# EAGLE design source_eagle (EAGLE 7.1.0)
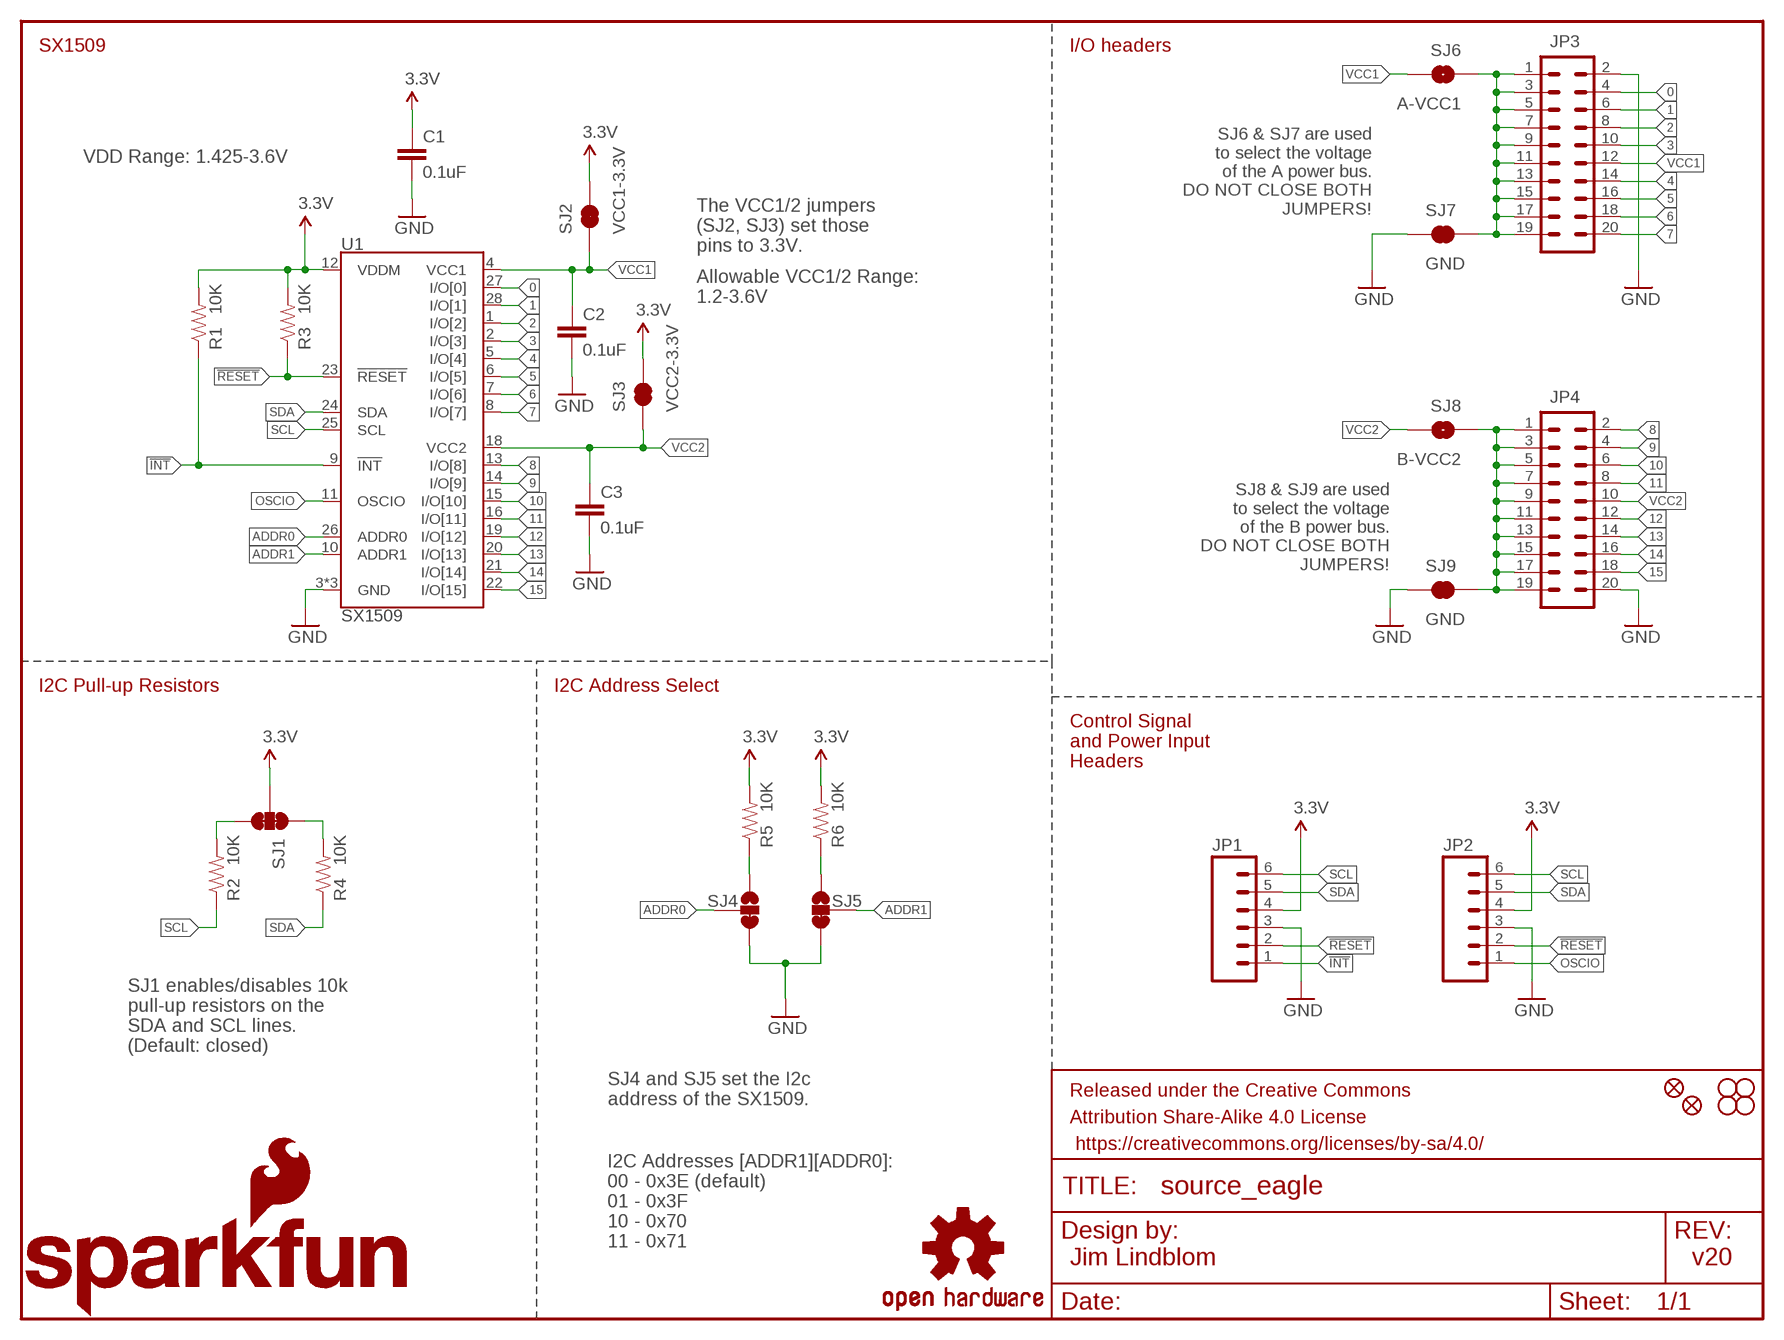
[diagram p0: schematic, sheet 1]

## Parts
C1  0.1uF  0.1UF-25V(+80/-20%)(0603)  [0603-CAP]
C2  0.1uF  0.1UF-25V(+80/-20%)(0603)  [0603-CAP]
C3  0.1uF  0.1UF-25V(+80/-20%)(0603)  [0603-CAP]
FRAME1  FRAME-LETTER  [CREATIVE_COMMONS]
JP1  M06SILK_FEMALE_PTH  [1X06]
JP2  M06SILK_FEMALE_PTH  [1X06]
JP3  M10X2ROUND_NOSILK  [2X10_ROUND_NOSILK]
JP4  M10X2ROUND_NOSILK  [2X10_ROUND_NOSILK]
JP9  FIDUCIAL1X2  [FIDUCIAL-1X2]
JP10  FIDUCIAL1X2  [FIDUCIAL-1X2]
LOGO1  SFE_LOGO_NAME_FLAME.1_INCH  [SFE_LOGO_NAME_FLAME_.1]
LOGO2  SFE_LOGO_FLAME.1_INCH  [SFE_LOGO_FLAME_.1]
LOGO3  OSHW-LOGOS  [OSHW-LOGO-S]
R1  10K  10KOHM-1/10W-1%(0603)0603  [0603-RES]
R2  10K  10KOHM-1/10W-1%(0603)0603  [0603-RES]
R3  10K  10KOHM-1/10W-1%(0603)0603  [0603-RES]
R4  10K  10KOHM-1/10W-1%(0603)0603  [0603-RES]
R5  10K  10KOHM-1/10W-1%(0603)0603  [0603-RES]
R6  10K  10KOHM-1/10W-1%(0603)0603  [0603-RES]
SJ1  JUMPER-PAD-3-NC_BY_TRACE  [PAD-JUMPER-3-3OF3_NC_BY_TRACE_YES_SILK_FULL_BOX]
SJ2  VCC1-3.3V  JUMPER-PAD-2-NC_BY_TRACE  [PAD-JUMPER-2-NC_BY_TRACE_YES_SILK]
SJ3  VCC2-3.3V  JUMPER-PAD-2-NC_BY_TRACE  [PAD-JUMPER-2-NC_BY_TRACE_YES_SILK]
SJ4  JUMPER-PAD-3-2OF3_NC_BY_TRACE_SMALL  [PAD-JUMPER-3-2OF3_NC_BY_TRACE_YES_SILK_FULL_BOX]
SJ5  JUMPER-PAD-3-2OF3_NC_BY_TRACE_SMALL  [PAD-JUMPER-3-2OF3_NC_BY_TRACE_YES_SILK_FULL_BOX]
SJ6  A-VCC1  JUMPER-PAD-2-NO  [PAD-JUMPER-2-NO_NO_SILK]
SJ7  GND  JUMPER-PAD-2-NC_BY_TRACENO_SILK  [PAD-JUMPER-2-NC_BY_TRACE_NO_SILK]
SJ8  B-VCC2  JUMPER-PAD-2-NO  [PAD-JUMPER-2-NO_NO_SILK]
SJ9  GND  JUMPER-PAD-2-NC_BY_TRACENO_SILK  [PAD-JUMPER-2-NC_BY_TRACE_NO_SILK]
STANDOFF1  STAND-OFF  [STAND-OFF]
STANDOFF2  STAND-OFF  [STAND-OFF]
STANDOFF3  STAND-OFF  [STAND-OFF]
STANDOFF4  STAND-OFF  [STAND-OFF]
U1  SX1509  [QFN-28]

## Nets
0: JP3.4 U1.27(I/O[0])
1: JP3.6 U1.28(I/O[1])
2: JP3.8 U1.1(I/O[2])
3: JP3.10 U1.2(I/O[3])
3.3V: C1.1 JP1.4 JP2.4 R1.2 R3.2 R5.2 R6.2 SJ1.2 SJ2.2 SJ3.2 U1.12(VDDM)
4: JP3.14 U1.5(I/O[4])
5: JP3.16 U1.6(I/O[5])
6: JP3.18 U1.7(I/O[6])
7: JP3.20 U1.8(I/O[7])
8: JP4.2 U1.13(I/O[8])
9: JP4.4 U1.14(I/O[9])
10: JP4.6 U1.15(I/O[10])
11: JP4.8 U1.16(I/O[11])
12: JP4.12 U1.19(I/O[12])
13: JP4.14 U1.20(I/O[13])
14: JP4.16 U1.21(I/O[14])
15: JP4.18 U1.22(I/O[15])
!INT: JP1.1 R1.1 U1.9(!INT)
!RESET: JP1.2 JP2.2 R3.1 U1.23(!RESET)
ADDR0: SJ4.2 U1.26(ADDR0)
ADDR1: SJ5.2 U1.10(ADDR1)
GND: C1.2 C2.2 C3.2 JP1.3 JP2.3 JP3.2 JP4.20 SJ4.3 SJ5.3 SJ7.1 SJ9.1 U1.3(GND) U1.17(GND) U1.29(GND)
N$1: R2.2 SJ1.3
N$2: R4.2 SJ1.1
N$3: JP4.1 JP4.3 JP4.5 JP4.7 JP4.9 JP4.11 JP4.13 JP4.15 JP4.17 JP4.19 SJ8.1 SJ9.2
N$8: R5.1 SJ4.1
N$9: R6.1 SJ5.1
OSCIO: JP2.1 U1.11(OSCIO)
PWRBUSA: JP3.1 JP3.3 JP3.5 JP3.7 JP3.9 JP3.11 JP3.13 JP3.15 JP3.17 JP3.19 SJ6.1 SJ7.2
SCL: JP1.6 JP2.6 R2.1 U1.25(SCL)
SDA: JP1.5 JP2.5 R4.1 U1.24(SDA)
VCC1: C2.1 JP3.12 SJ2.1 SJ6.2 U1.4(VCC1)
VCC2: C3.1 JP4.10 SJ3.1 SJ8.2 U1.18(VCC2)

## Notes on the sheet
- SX1509 | I/O headers
- SJ6 & SJ7 are used
  to select the voltage
  of the A power bus.
  DO NOT CLOSE BOTH
  JUMPERS!
- VDD Range: 1.425-3.6V
- The VCC1/2 jumpers 
  (SJ2, SJ3) set those 
  pins to 3.3V.
- Allowable VCC1/2 Range: 
  1.2-3.6V
- SJ8 & SJ9 are used
  to select the voltage
  of the B power bus.
  DO NOT CLOSE BOTH
  JUMPERS!
- I2C Pull-up Resistors | I2C Address Select
- Control Signal
  and Power Input
  Headers
- SJ1 enables/disables 10k
  pull-up resistors on the
  SDA and SCL lines.
  (Default: closed)
- SJ4 and SJ5 set the I2c
  address of the SX1509.
- I2C Addresses [ADDR1][ADDR0]:
  00 - 0x3E (default)
  01 - 0x3F
  10 - 0x70
  11 - 0x71
- Jim Lindblom | v20

## Library data of the parts
C1-C3 = SparkFun-Capacitors:0.1UF-25V(+80/-20%)(0603): CAP-00810 Ceramic Standard decoupling cap; PROD_ID: CAP-00810
FRAME1 = SparkFun-Aesthetics:FRAME-LETTER: Schematic Frame Standard 8.5x11 US Letter frame; DESIGNER: NAME; VERSION: v01
JP1 JP2 = SparkFun-Connectors:M06: Header 6 Standard 6-pin 0.1" header. Use with straight break away headers (SKU : PRT-00116), right angle break away headers (PRT-00553), swiss pins (PRT-00743), machine pins (PRT-00117), and female headers (PRT-00115). Molex polarized connector foot print use with SKU : PRT-08094 with associated crimp pins and housings. NOTES ON THE VARIANTS LOCK and LOCK_LONGPADS... This footprint was designed to help hold the alignment of a through-hole component (i.e. 6-pin header) while soldering it into place. You may notice that each hole has been shifted either up or down by 0.005 of an inch from it's more standard position (which is a perfectly straight line). This slight alteration caused the pins (the squares in the middle) to touch the edges of the holes. Because they are alternating, it causes a "brace" to hold the component in place. 0.005 has proven to be the perfect amount of "off-center" position when using our standard breakaway headers. Although looks a little odd when you look at the bare footprint, once you have a header in there, the alteration is very hard to notice. Also,if you push a header all the way into place, it is covered up entirely on the bottom side. This idea of altering the position of holes to aid alignment will be further integrated into the Sparkfun Library for other footprints. It can help hold any component with 3 or more connection pins.; PROD_ID: CONN-08437
JP3 JP4 = SparkFun-Connectors:M10X2: This was SPECIALLY designed to be used with our Graphic LCD Backpack. Be sure you want to use this! It is not only staggered on each line of header holes, but IT IS ALSO offset of the center point of the top and bottom lines by 5 mil. This causes the headers to lock into place on the "standard" footprint on the LCD screen. The extra squares on the tdocu layer are there simply to reference other pins (if you were to actually populate a longer header than ten long - this is what we do with the backpacks).
JP9 JP10 = SparkFun:FIDUCIAL: Fiducial Alignment Points Various fiducial points for machine vision alignment.
LOGO1 = SparkFun-Aesthetics:SFE_LOGO_NAME_FLAME: SFE Logo, name and flame This is the SparkFun full logo. The logo on the schematic will always be the same size; the package variant is the height of the flame part of the logo. Default layer for the logo on the board is tSilk.
LOGO2 = SparkFun-Aesthetics:SFE_LOGO_FLAME: SFE Logo, flame only This is the SparkFun flame logo. The logo on the schematic will always be the same size; the package variant is the height of the flame. Default layer for the logo on the board is tSilk.
LOGO3 = SparkFun-Aesthetics:OSHW-LOGO: Open Source Hardware Logo This logo indicates the piece of hardware it is found on incorporates a OSHW license and/or adheres to the definition of open source hardware found here: http://freedomdefined.org/OSHW
R1-R6 = SparkFun-Resistors:10KOHM-1/10W-1%(0603): RES-00824; PROD_ID: RES-00824
SJ1 = SparkFun-Passives:JUMPER-PAD-3-NC_BY_TRACE
SJ2 SJ3 SJ7 SJ9 = SparkFun-Passives:JUMPER-PAD-2-NC_BY_TRACE
SJ4 SJ5 = SparkFun-Passives:JUMPER-PAD-3-2OF3_NC_BY_TRACE
SJ6 SJ8 = SparkFun-Passives:JUMPER-PAD-2-NO
STANDOFF1-STANDOFF4 = SparkFun-Electromechanical:STAND-OFF: #4 Stand Off This is the mechanical footprint for a #4 phillips button head screw. Use the keepout ring to avoid running the screw head into surrounding components. SKU : PRT-00447
U1 = SparkFun-DigitalIC:SX1509: Semtech SX1509 The SX1509 is a complete ultra low voltage 1.2V to 3.6V General Purpose parallel Input/Output (GPIO) expanders ideal for low power handheld battery powered equipment. This version comes in a 16-channel configuration and allows easy serial expansion of I/O through a standard 400kHz I2C interface. GPIO devices can provide additional control and monitoring when the microcontroller or chipset has insufficient I/O ports, or in systems where serial communication and control from a remote location is advantageous.; PROD_ID: IC-11311

## Board
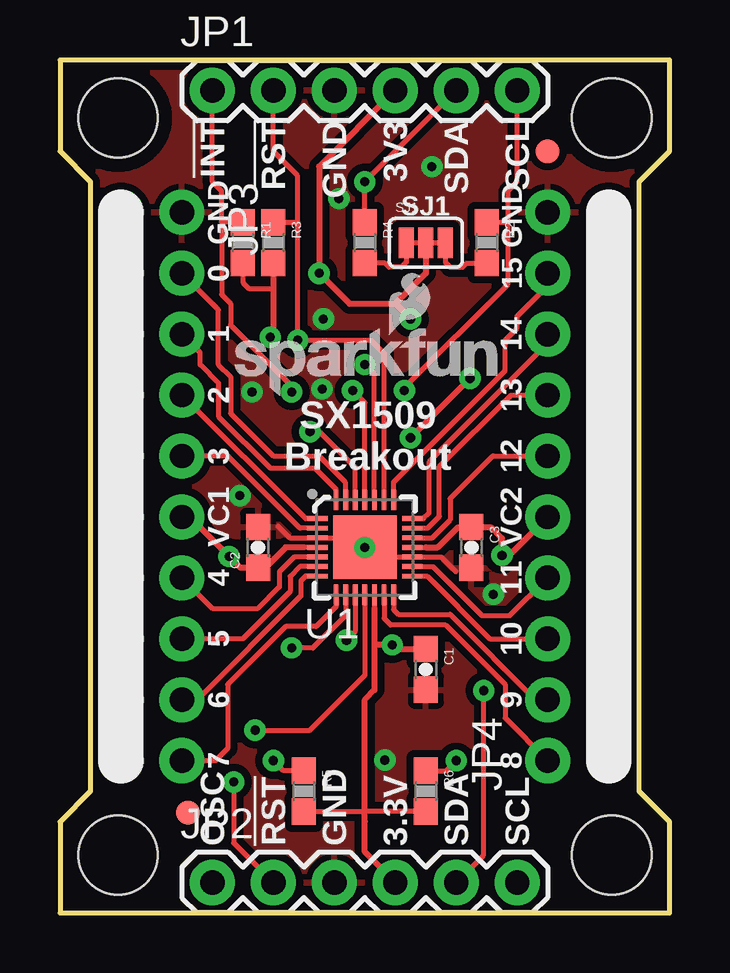
[diagram p1: board, top side]
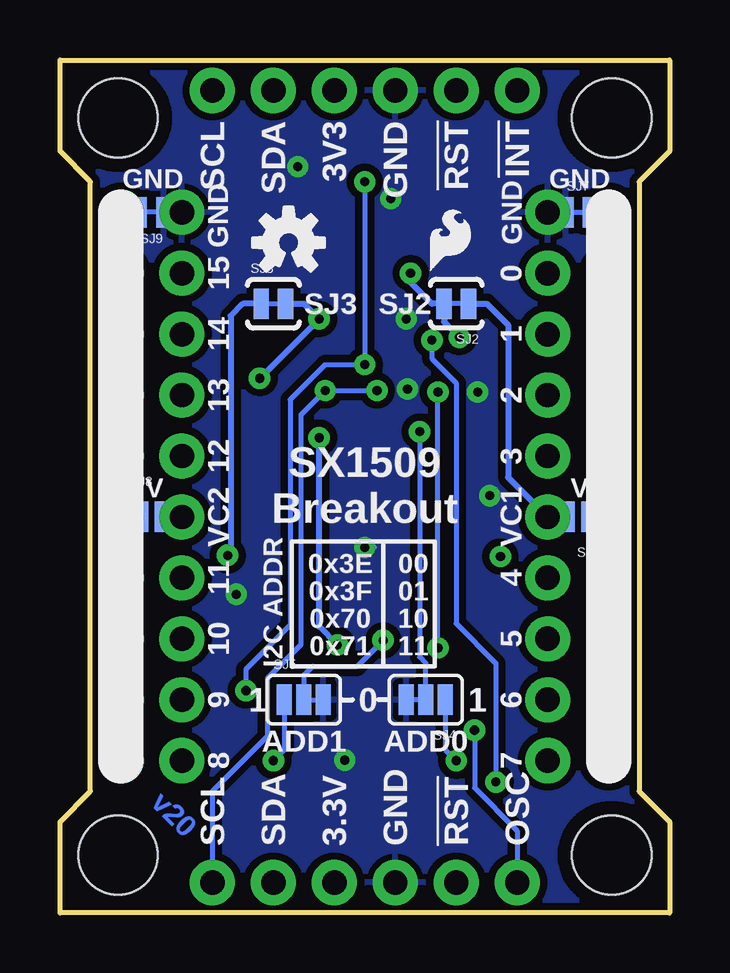
[diagram p2: board, bottom side, seen from below]

Size 25.4 x 35.56 mm. Coordinates in mm from the lower left corner, seen from the top.
Outline: 0,35.56 0,31.75 1.27,30.48 1.27,5.08 0,3.81 0,0 25.4,0 25.4,3.81 24.13,5.08 24.13,30.48 25.4,31.75 25.4,35.56 0,35.56
Copper layers (1*16): Top 0.035mm / dielectric 1.5mm / Bottom 0.035mm
Design rules "SparkFun-2-layer *": minimum track width 7mil, minimum drill 15mil, track to track 6mil, track to pad 6mil, pad to pad 6mil, via to via 6mil, smd to smd 6mil, copper to edge 8mil, drill to drill 8mil, minimum pad ring 12mil, minimum via ring 10mil, stop-mask expansion 4mil, vias tented up to drill 20mil, thermal gap 10mil

### Footprints (pad centres in the part's own frame; a part is rotated, then mirrored left to right if it is on the bottom)
0603-CAP = smd 1.1 x 1: 1 -0.85,0; 2 0.85,0
1X06 = drill 1.016 pad 1.88: 1 0,0; 2 2.54,0; 3 5.08,0; 4 7.62,0; 5 10.16,0; 6 12.7,0
2X10_ROUND_NOSILK = drill 1.016 pad 1.88: 1 -11.43,-1.27; 2 -11.43,1.27; 3 -8.89,-1.27; 4 -8.89,1.27; 5 -6.35,-1.27; 6 -6.35,1.27; 7 -3.81,-1.27; 8 -3.81,1.27; 9 -1.27,-1.27; 10 -1.27,1.27; 11 1.27,-1.27; 12 1.27,1.27; 13 3.81,-1.27; 14 3.81,1.27; 15 6.35,-1.27; 16 6.35,1.27; 17 8.89,-1.27; 18 8.89,1.27; 19 11.43,-1.27; 20 11.43,1.27
FIDUCIAL-1X2 = smd 1 x 1: 1 0,0
0603-RES = smd 1.1 x 1: 1 -0.85,0; 2 0.85,0
PAD-JUMPER-3-3OF3_NC_BY_TRACE_YES_SILK_FULL_BOX = smd 0.635 x 1.27: 1 -0.813,0; 2 0,0; 3 0.813,0
PAD-JUMPER-2-NC_BY_TRACE_YES_SILK = smd 0.635 x 1.27: 1 -0.508,0; 2 0.508,0
PAD-JUMPER-3-2OF3_NC_BY_TRACE_YES_SILK_FULL_BOX = smd 0.635 x 1.27: 1 -0.813,0; 2 0,0; 3 0.813,0
PAD-JUMPER-2-NO_NO_SILK = smd 0.635 x 1.27: 1 -0.45,0; 2 0.45,0
PAD-JUMPER-2-NC_BY_TRACE_NO_SILK = smd 0.635 x 1.27: 1 -0.508,0; 2 0.508,0
STAND-OFF = hole 3.302: 0,0
QFN-28 = smd 0.85 x 0.2: 1 -1.975,1.2; 2 -1.975,0.8; 3 -1.975,0.4; 4 -1.975,0; 5 -1.975,-0.4; 6 -1.975,-0.8; 7 -1.975,-1.2; 15 1.975,-1.2; 16 1.975,-0.8; 17 1.975,-0.4; 18 1.975,0; 19 1.975,0.4; 20 1.975,0.8; 21 1.975,1.2 | smd 0.2 x 0.85: 8 -1.2,-1.975; 9 -0.8,-1.975; 10 -0.4,-1.975; 11 0,-1.975; 12 0.4,-1.975; 13 0.8,-1.975; 14 1.2,-1.975; 22 1.2,1.975; 23 0.8,1.975; 24 0.4,1.975; 25 0,1.975; 26 -0.4,1.975; 27 -0.8,1.975; 28 -1.2,1.975 | smd 2.65 x 2.65: 29 0,0

### Placement (x,y rotation side)
C1  15.24,10.16 270 top
C2  8.26,15.24 90 top
C3  17.14,15.24 270 top
FRAME1  not placed on the board
JP1  6.35,34.29 0 top
JP2  6.35,1.27 0 top
JP3  3.81,17.78 270 top
JP4  21.59,17.78 90 top
JP9  20.32,31.75 0 top
JP10  5.33,4.19 0 top
LOGO1  6.86,21.46 0 top
LOGO2  10.29,26.42 0 bottom
LOGO3  15.88,27.94 0 bottom
R1  7.62,27.94 270 top
R2  17.78,27.94 270 top
R3  8.89,27.94 270 top
R4  12.7,27.94 270 top
R5  10.16,5.08 270 top
R6  15.24,5.08 270 top
SJ1  15.24,27.94 0 top
SJ2  8.89,25.4 180 bottom
SJ3  16.51,25.4 0 bottom
SJ4  10.16,8.89 180 bottom
SJ5  15.24,8.89 0 bottom
SJ6  3.81,16.51 180 bottom
SJ7  3.81,29.21 0 bottom
SJ8  21.59,16.51 0 bottom
SJ9  21.59,29.21 180 bottom
STANDOFF1  2.41,2.41 0 top
STANDOFF2  2.41,33.15 0 top
STANDOFF3  22.99,2.41 0 top
STANDOFF4  22.99,33.15 0 top
U1  12.7,15.24 0 top

### Tracks (layer width: path | path; a pad name or v marks a point on that pad's centre or on a via)
0
  Top 0.203: U1.27 11.9,17.95 10.79,19.05 8.89,19.05 7.11,20.83 7.11,22.35 6.6,22.86 6.6,25.15 JP3.4
1
  Top 0.203: U1.28 11.5,17.65 10.6,18.54 8.76,18.54 6.6,20.7 6.6,22.1 5.84,22.86 5.84,23.37 JP3.6
2
  Top 0.203: U1.1 10.23,16.44 JP3.8
3
  Top 0.203: U1.2 9.99,16.04 6.99,19.05 JP3.10
3.3V  (via drill 0.38)
  Top 0.203: U1.12 13.1,12.7 | R5.2 12.7,4.23 | R6.2 12.7,4.23 | 12.7,4.23 12.7,3.81 | R1.2 7.62,26.29 7.87,26.04 8.89,26.04
  Top 0.254: JP1.4 10.79,31.11 v10.79,26.67 12.06,25.4 13.97,25.4 | v14.61,24.77 13.97,25.4 | JP2.4 12.7,2.54 12.7,3.81 12.7,8.89 13.1,9.29 13.1,11.18 | 13.1,11.18 v13.84,11.18 14.01,11.01 C1.1 | 13.1,12.7 13.1,11.18 | v17.08,22.29 v14.61,19.81 | SJ1.2 15.24,26.67 13.97,25.4 | R3.2 8.89,26.04 8.89,24.13 v8.76,24
  Bottom 0.254: v17.08,22.29 v14.61,24.77 15.24,25.4 SJ3.2 | v13.84,11.18 14.61,11.94 v14.61,19.81 | v8.76,24 9.4,24.64 SJ2.2 9.91,25.4 10.79,26.29 v10.79,26.67
4
  Top 0.203: U1.5 9.76,14.84 9.14,14.22 9.14,13.59 8.26,12.7 6.35,12.7 JP3.14
5
  Top 0.203: U1.6 9.99,14.44 9.59,14.03 9.59,13.4 7.62,11.43 JP3.16
6
  Top 0.203: U1.7 10.23,14.04 10.03,13.84 10.03,13.21 5.71,8.89 JP3.18
7
  Top 0.203: U1.8 11.5,12.77 10.67,11.94 9.4,11.94 6.99,9.53 6.99,6.86 6.48,6.35 JP3.20
8
  Top 0.203: U1.13 13.5,12.28 13.78,12 16.07,12 18.54,9.53 18.54,8.13 JP4.2
9
  Top 0.203: U1.14 13.9,12.64 14.1,12.45 16.26,12.45 19.81,8.89 JP4.4
10
  Top 0.203: U1.15 15.3,14.04 17.91,11.43 JP4.6
11
  Top 0.203: U1.16 15.53,14.44 17.58,12.39 18.75,12.39 JP4.8
12
  Top 0.203: U1.19 15.51,15.64 16.26,16.38 16.26,17.27 18.03,19.05 JP4.12
13
  Top 0.203: U1.20 15.32,16.04 15.81,16.54 15.81,18.61 18.8,21.59 JP4.14
14
  Top 0.203: U1.21 15.14,16.44 15.37,16.66 15.37,18.8 20.32,23.75 JP4.16
15
  Top 0.203: U1.22 13.9,17.96 18.54,22.61 18.54,23.88 19.05,24.38 19.05,24.89 20.32,26.16 JP4.18
!INT  (via drill 0.38)
  Top 0.203: U1.9 11.9,12.41 10.54,11.05 v9.65,11.05 | 6.73,28.79 6.73,30.1 6.35,30.48 JP1.1 | R1.1 6.73,28.79 | v9.65,21.72 9.65,21.97 7.11,24.51 7.11,25.4 6.73,25.78 6.73,28.79
  Bottom 0.203: v9.65,11.05 v9.65,21.72
!RESET  (via drill 0.38)
  Top 0.203: U1.23 13.5,23.33 12.95,23.88 v9.91,23.88 9.91,28.79 | JP1.2 8.89,31.75 9.91,30.73 9.91,28.79 | R3.1 9.91,28.79 | v7.24,5.46 7.24,2.92 JP2.2
  Bottom 0.203: v7.24,5.46 7.24,10.41 8.89,12.06 8.89,22.1 9.91,23.11 v9.91,23.88
ADDR0  (via drill 0.38)
  Top 0.203: U1.26 12.3,18.56 10.79,20.07 v10.41,20.07
  Bottom 0.203: v10.41,20.07 10.41,10.67 10.16,10.41 SJ4.2
ADDR1  (via drill 0.38)
  Top 0.203: U1.10 12.3,11.73 v11.94,11.37
  Bottom 0.203: SJ5.2 15.24,9.91 14.86,10.29 13.02,10.29 v11.94,11.37
GND  (via drill 0.38)
  Top 0.203: 12.7,15.64 U1.29 | 16.51,14.22 15.89,14.84 U1.17 13.1,14.84 U1.29 | 9.08,16.13 9.57,15.64 U1.3 12.3,15.64 U1.29
  Bottom 0.203: U1.29 12.3,15.24 | SJ7.1 JP3.2 | SJ9.1 JP4.20
  other vias: 12.7,15.24 10.92,21.84 10.97,24.77 11.62,29.78 15.49,31.11 13.54,6.38 18.06,13.28 7.49,17.4 8,21.72
  pour Top (isolate 0.305): 0,35.56 0,0 25.4,0 25.4,35.56
  pour Bottom (isolate 0.305): 0,35.56 0,0 25.4,0 25.4,35.56
N$1
  Top 0.203: SJ1.3 16.05,27.13 16.26,26.92 16.76,26.92 16.93,27.09 R2.2
N$2
  Top 0.203: SJ1.1 14.43,27.13 14.22,26.92 13.72,26.92 13.55,27.09 R4.2
N$3
  Top 0.254: JP4.19 JP4.17 JP4.15 JP4.13 JP4.11 JP4.9 JP4.7 JP4.5 JP4.3 JP4.1
  Bottom 0.203: SJ8.1 JP4.9 | SJ9.2 JP4.19
N$8  (via drill 0.38)
  Top 0.203: R5.1 9.31,5.93 v8.89,6.35
  Bottom 0.203: SJ4.1 9.35,6.81 v8.89,6.35
N$9  (via drill 0.38)
  Top 0.203: R6.1 16.09,5.93 v16.51,6.35
  Bottom 0.203: SJ5.1 16.05,6.81 v16.51,6.35
OSCIO  (via drill 0.38)
  Top 0.203: U1.11 12.7,9.91 10.41,7.62 v8.13,7.62
  Bottom 0.203: v8.13,7.62 8.13,5.21 6.35,3.43 JP2.1
PWRBUSA
  Top 0.254: JP3.19 JP3.17 JP3.15 JP3.13 JP3.11 JP3.9 JP3.7 JP3.5 JP3.3 JP3.1
  Bottom 0.203: SJ6.1 JP3.11 | SJ7.2 JP3.1
SCL  (via drill 0.38)
  Top 0.203: U1.25 12.7,21.27 v12.19,21.78 | 18.67,28.79 18.67,26.23 14.35,21.91 v14.35,21.78 | 18.67,28.79 18.67,30.1 19.05,30.48 JP1.6 | R2.1 18.67,28.79
  Bottom 0.203: v12.19,21.78 v14.35,21.78 15.37,20.77 15.37,11.18 16.76,9.78 16.76,7.37 19.05,5.08 JP2.6
SDA  (via drill 0.38)
  Top 0.203: U1.24 13.1,22.46 v12.7,22.86 | JP1.5 v12.7,30.48 R4.1 | JP2.5 17.65,2.41 v17.65,9.27
  Bottom 0.203: v17.65,9.27 17.65,10.16 15.81,12 15.81,21.4 14.35,22.86 v12.7,22.86 v12.7,30.48
VCC1  (via drill 0.38)
  Top 0.203: U1.4 10.16,15.24
  Top 0.254: 10.16,15.24 9.4,15.24 8.55,14.39 C2.1 7.52,14.39 v7.05,14.86 5.4,16.51 JP3.12
  Bottom 0.203: SJ6.2 JP3.12
  Bottom 0.254: SJ2.1 7.62,25.4 6.73,24.51 6.73,18.16 JP3.12
VCC2  (via drill 0.38)
  Top 0.203: U1.18 15.24,15.24
  Top 0.254: 15.24,15.24 15.75,15.24 16.6,16.09 C3.1 17.95,16.09 18.41,15.62 v18.41,14.91 18.72,14.91 JP4.10
  Bottom 0.203: SJ8.2 JP4.10
  Bottom 0.254: v18.41,14.91 18.29,15.04 18.29,24.89 17.78,25.4 SJ3.1

### Text on the board
Bottom: v20
tPlace: !INT | !RST | GND | 3V3 | SDA | SCL | GND | SJ1 | GND | 0 | 15 | 1 | 14 | 2 | 13 | SX1509 / Breakout | 3 | 12 | VC1 | VC2 | 4 | 11 | 5 | 10 | 6 | 9 | 7 | 8 | OSC | !RST | GND | 3.3V | SDA | SCL
bPlace: !INT | !RST | GND | 3V3 | SDA | SCL | GND | GND | GND | GND | 0 | 15 | SJ2 | SJ3 | 1 | 14 | 2 | 13 | 3 | 12 | V | VC1 | VC2 | V | SX1509 / Breakout | 00 | 0x3E | 4 | 01 | 0x3F | 11 | 10 | 0x70 | I2C ADDR | 11 | 0x71 | 5 | 10 | 6 | 1 | 0 | 1 | 9 | ADD0 | ADD1 | 7 | 8 | OSC | !RST | GND | 3.3V | SDA | SCL
Measures: Units: inches
tDocu: Jim Lindblom